# EasyEDA Pro project ProPrj_CC14_SAOs_2026-02-15.epro

# Schematic Schematic1_1
Board Name: EveLike; Create Date: 2026-01-02; Page Name: P1; Project Name: CC14_SAOs; Schematic Name: Schematic1; Update Date: 2026-01-02; Company: EasyEDA.com; Page Size: A4; Version: V1.0
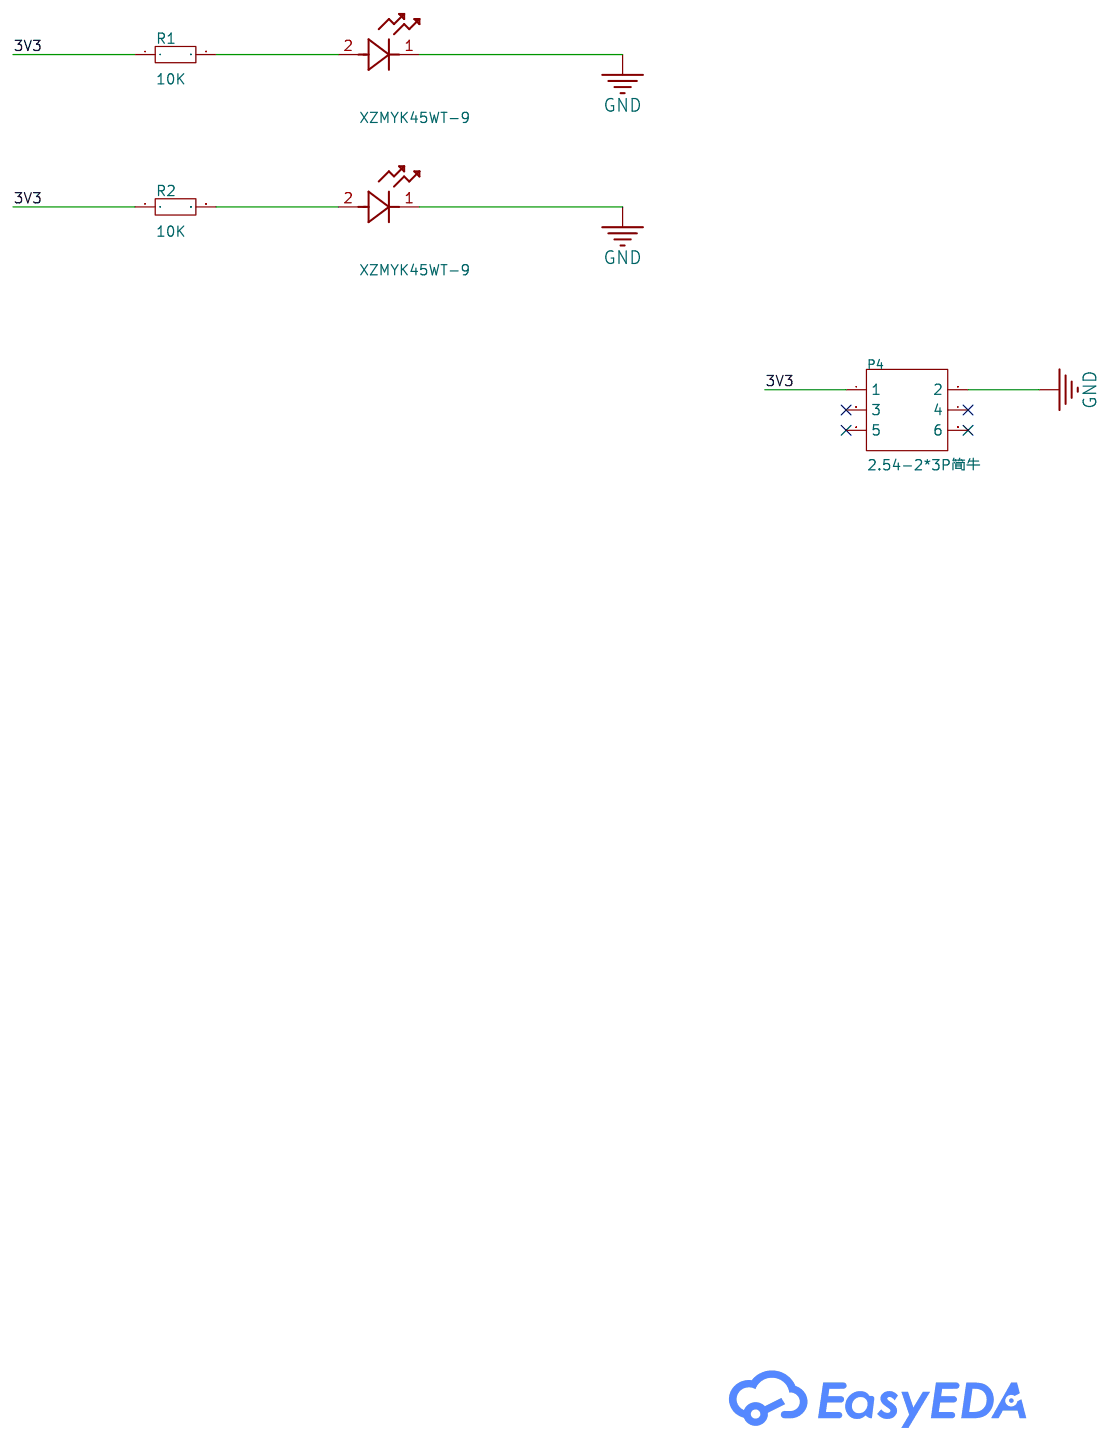
[diagram p0: schematic sheet]

## Parts
LED1  XZMYK45WT-9  [LED_SMD_PLCC2_SLD]
LED2  XZMYK45WT-9  [LED_SMD_PLCC2_SLD]
P4  2.54-2*3P简牛  [IDC-TH_6P-P2.54_C11214]  (no BOM)
R1  10K  [R1206-1]
R2  10K  [R1206-1]

## Library data of the parts
LED1 LED2 = XZMYK45WT-9
P4 = 2.54-2*3P简牛: Connector Type:IDC Header Pitch:2.54mm Holder Type:Through Hole Row Spacing:2.54mm Number of Rows:2 Contact Material:Brass Contact Plating:Gold; LCSC Part Name: 2.54mm 排数:2; Supplier Part: C11214; Manufacturer: BOOMELE(博穆精密); Supplier Footprint: 插件,P=2.54mm; JLCPCB Part Class: Extended Part; Datasheet: https://item.szlcsc.com/datasheet/2.54-2*3P%25E7%25AE%2580%25E7%2589%259B/11763.html; Supplier: LCSC; Connector Type: IDC Header; Pitch: 2.54mm; Holder Type: Through Hole; Row Spacing: 2.54mm; Number of Rows: 2; Contact Material: Brass; Contact Plating: Gold
R1 R2 = Res_0603: Supplier Footprint: 0603

## Nets
3V3: P4.1 R1.1 R2.1
GND: LED1.1 LED2.1 P4.2
$1N236: LED1.2 R1.2
$1N245: LED2.2 R2.2

Not connected (* = marked no-connect by the designer): P4 3* 4* 5* 6*

# Schematic Schematic4
Board Name: Board2; Create Date: 2026-01-09; Page Name: P1; Project Name: CC14_SAOs; Schematic Name: Schematic4; Update Date: 2026-01-09; Company: EasyEDA.com; Page Size: A4; Version: V1.0
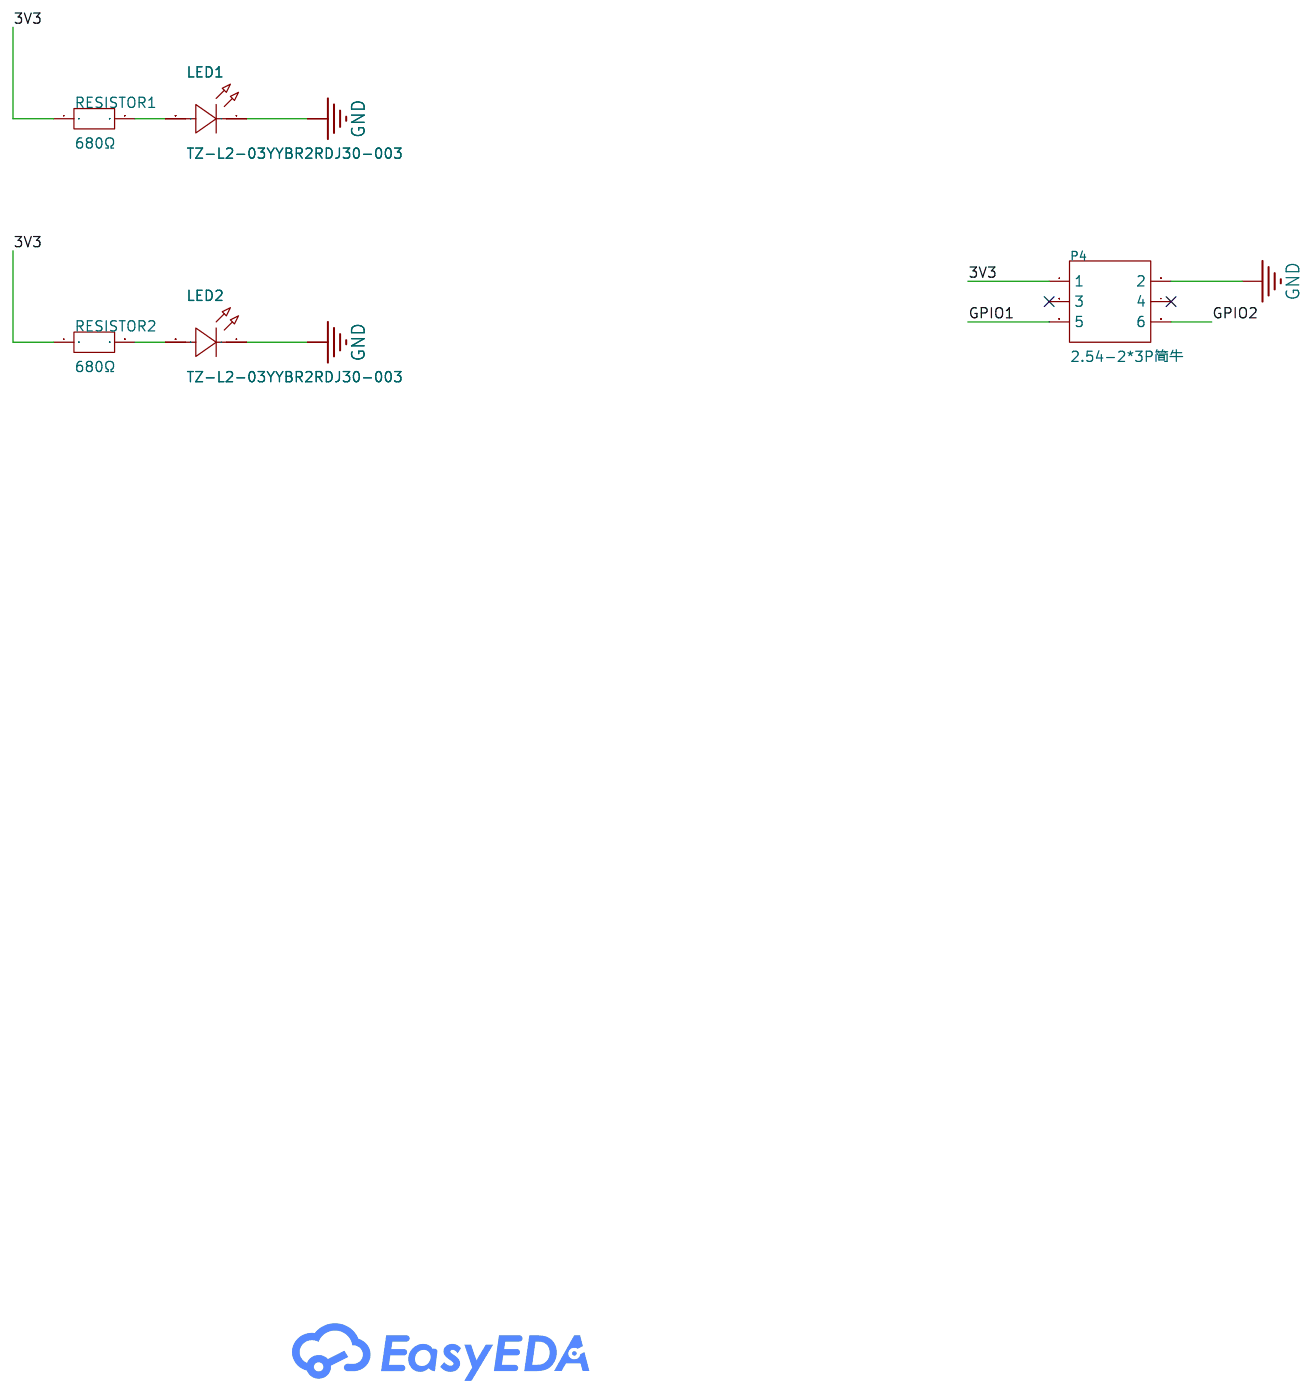
[diagram p1: schematic sheet]

## Parts
LED1  TZ-L2-03YYBR2RDJ30-003  [LED-TH_BD3.8-P2.54-RD]  (no BOM)
LED2  TZ-L2-03YYBR2RDJ30-003  [LED-TH_BD3.8-P2.54-RD]  (no BOM)
P4  2.54-2*3P简牛  [IDC-TH_6P-P2.54_C11214]  (no BOM)
RESISTOR1  680Ω  [RES-TH_BD3.4-W6.3-P7.62-SA6.8CA]
RESISTOR2  680Ω  [RES-TH_BD3.4-W6.3-P7.62-SA6.8CA]

## Library data of the parts
LED1 LED2 = TZ-L2-03YYBR2RDJ30-003: Lamp Holder Type:3mm Round Lens Illumination Color:Red Voltage - Forward(Vf):2.3V Voltage - Forward(Vf):2.3V Power(Watts):60mW Forward Current:20mA Wavelength - Dominant:620nm~625nm Wavelength - Dominant:620nm~625nm Peak Wavelength:- Diode Configuration:-; LCSC Part Name: 红灯; Supplier Part: C779429; Manufacturer: TUOZHAN(拓展光电); Supplier Footprint: 插件,D=3mm; JLCPCB Part Class: Extended Part; Datasheet: https://item.szlcsc.com/datasheet/TZ-L2-03YYBR2RDJ30-003/829090.html; Supplier: LCSC; Lamp Holder Type: 3mm Round Lens; Illumination Color: Red; Voltage - Forward(Vf): 2.3V; Power(Watts): 60mW; Forward Current: 20mA; Wavelength - Dominant: 620nm~625nm; Lens Color: Red Lens; Luminous Intensity: 600mcd; Viewing Angle: 30°; Operating Temperature: -20℃~+75℃
P4 = 2.54-2*3P简牛: Connector Type:IDC Header Pitch:2.54mm Holder Type:Through Hole Row Spacing:2.54mm Number of Rows:2 Contact Material:Brass Contact Plating:Gold; LCSC Part Name: 2.54mm 排数:2; Supplier Part: C11214; Manufacturer: BOOMELE(博穆精密); Supplier Footprint: 插件,P=2.54mm; JLCPCB Part Class: Extended Part; Datasheet: https://item.szlcsc.com/datasheet/2.54-2*3P%25E7%25AE%2580%25E7%2589%259B/11763.html; Supplier: LCSC; Connector Type: IDC Header; Pitch: 2.54mm; Holder Type: Through Hole; Row Spacing: 2.54mm; Number of Rows: 2; Contact Material: Brass; Contact Plating: Gold
RESISTOR1 RESISTOR2 = MBA02040C6800FRP00: Type:Metal Film Resistor Resistance:680Ω Tolerance:±1% Tolerance:±1% Power(Watts):400mW Temperature Coefficient:±50ppm/℃ Temperature Coefficient:±50ppm/℃ Operating Temperature:-55℃~+155℃ Operating Temperature:-55℃~+155℃; LCSC Part Name: 金属膜电阻 680Ω ±1% 400mW; Supplier Part: C1740698; Manufacturer: VISHAY(威世); Supplier Footprint: 插件; JLCPCB Part Class: Extended Part; Datasheet: https://item.szlcsc.com/datasheet/MBA02040C6800FRP00/1831479.html; Supplier: LCSC; Type: Metal Film Resistor; Tolerance: ±1%; Power(Watts): 400mW; Temperature Coefficient: ±50ppm/℃; Operating Temperature: -55℃~+155℃

## Nets
3V3: P4.1 RESISTOR1.1 RESISTOR2.1
GND: LED1.1(-) LED2.1(-) P4.2
GPIO1: P4.5
GPIO2: P4.6
Net-(LED1-2): LED1.2(+) RESISTOR1.2
Net-(LED2-2): LED2.2(+) RESISTOR2.2

Not connected (* = marked no-connect by the designer): P4 3* 4*

# Schematic Schematic2
Board Name: Bluetooth; Create Date: 2026-01-06; Page Name: P1; Project Name: CC14_SAOs; Schematic Name: Schematic2; Update Date: 2026-01-15; Company: EasyEDA.com; Page Size: A4; Version: V1.0
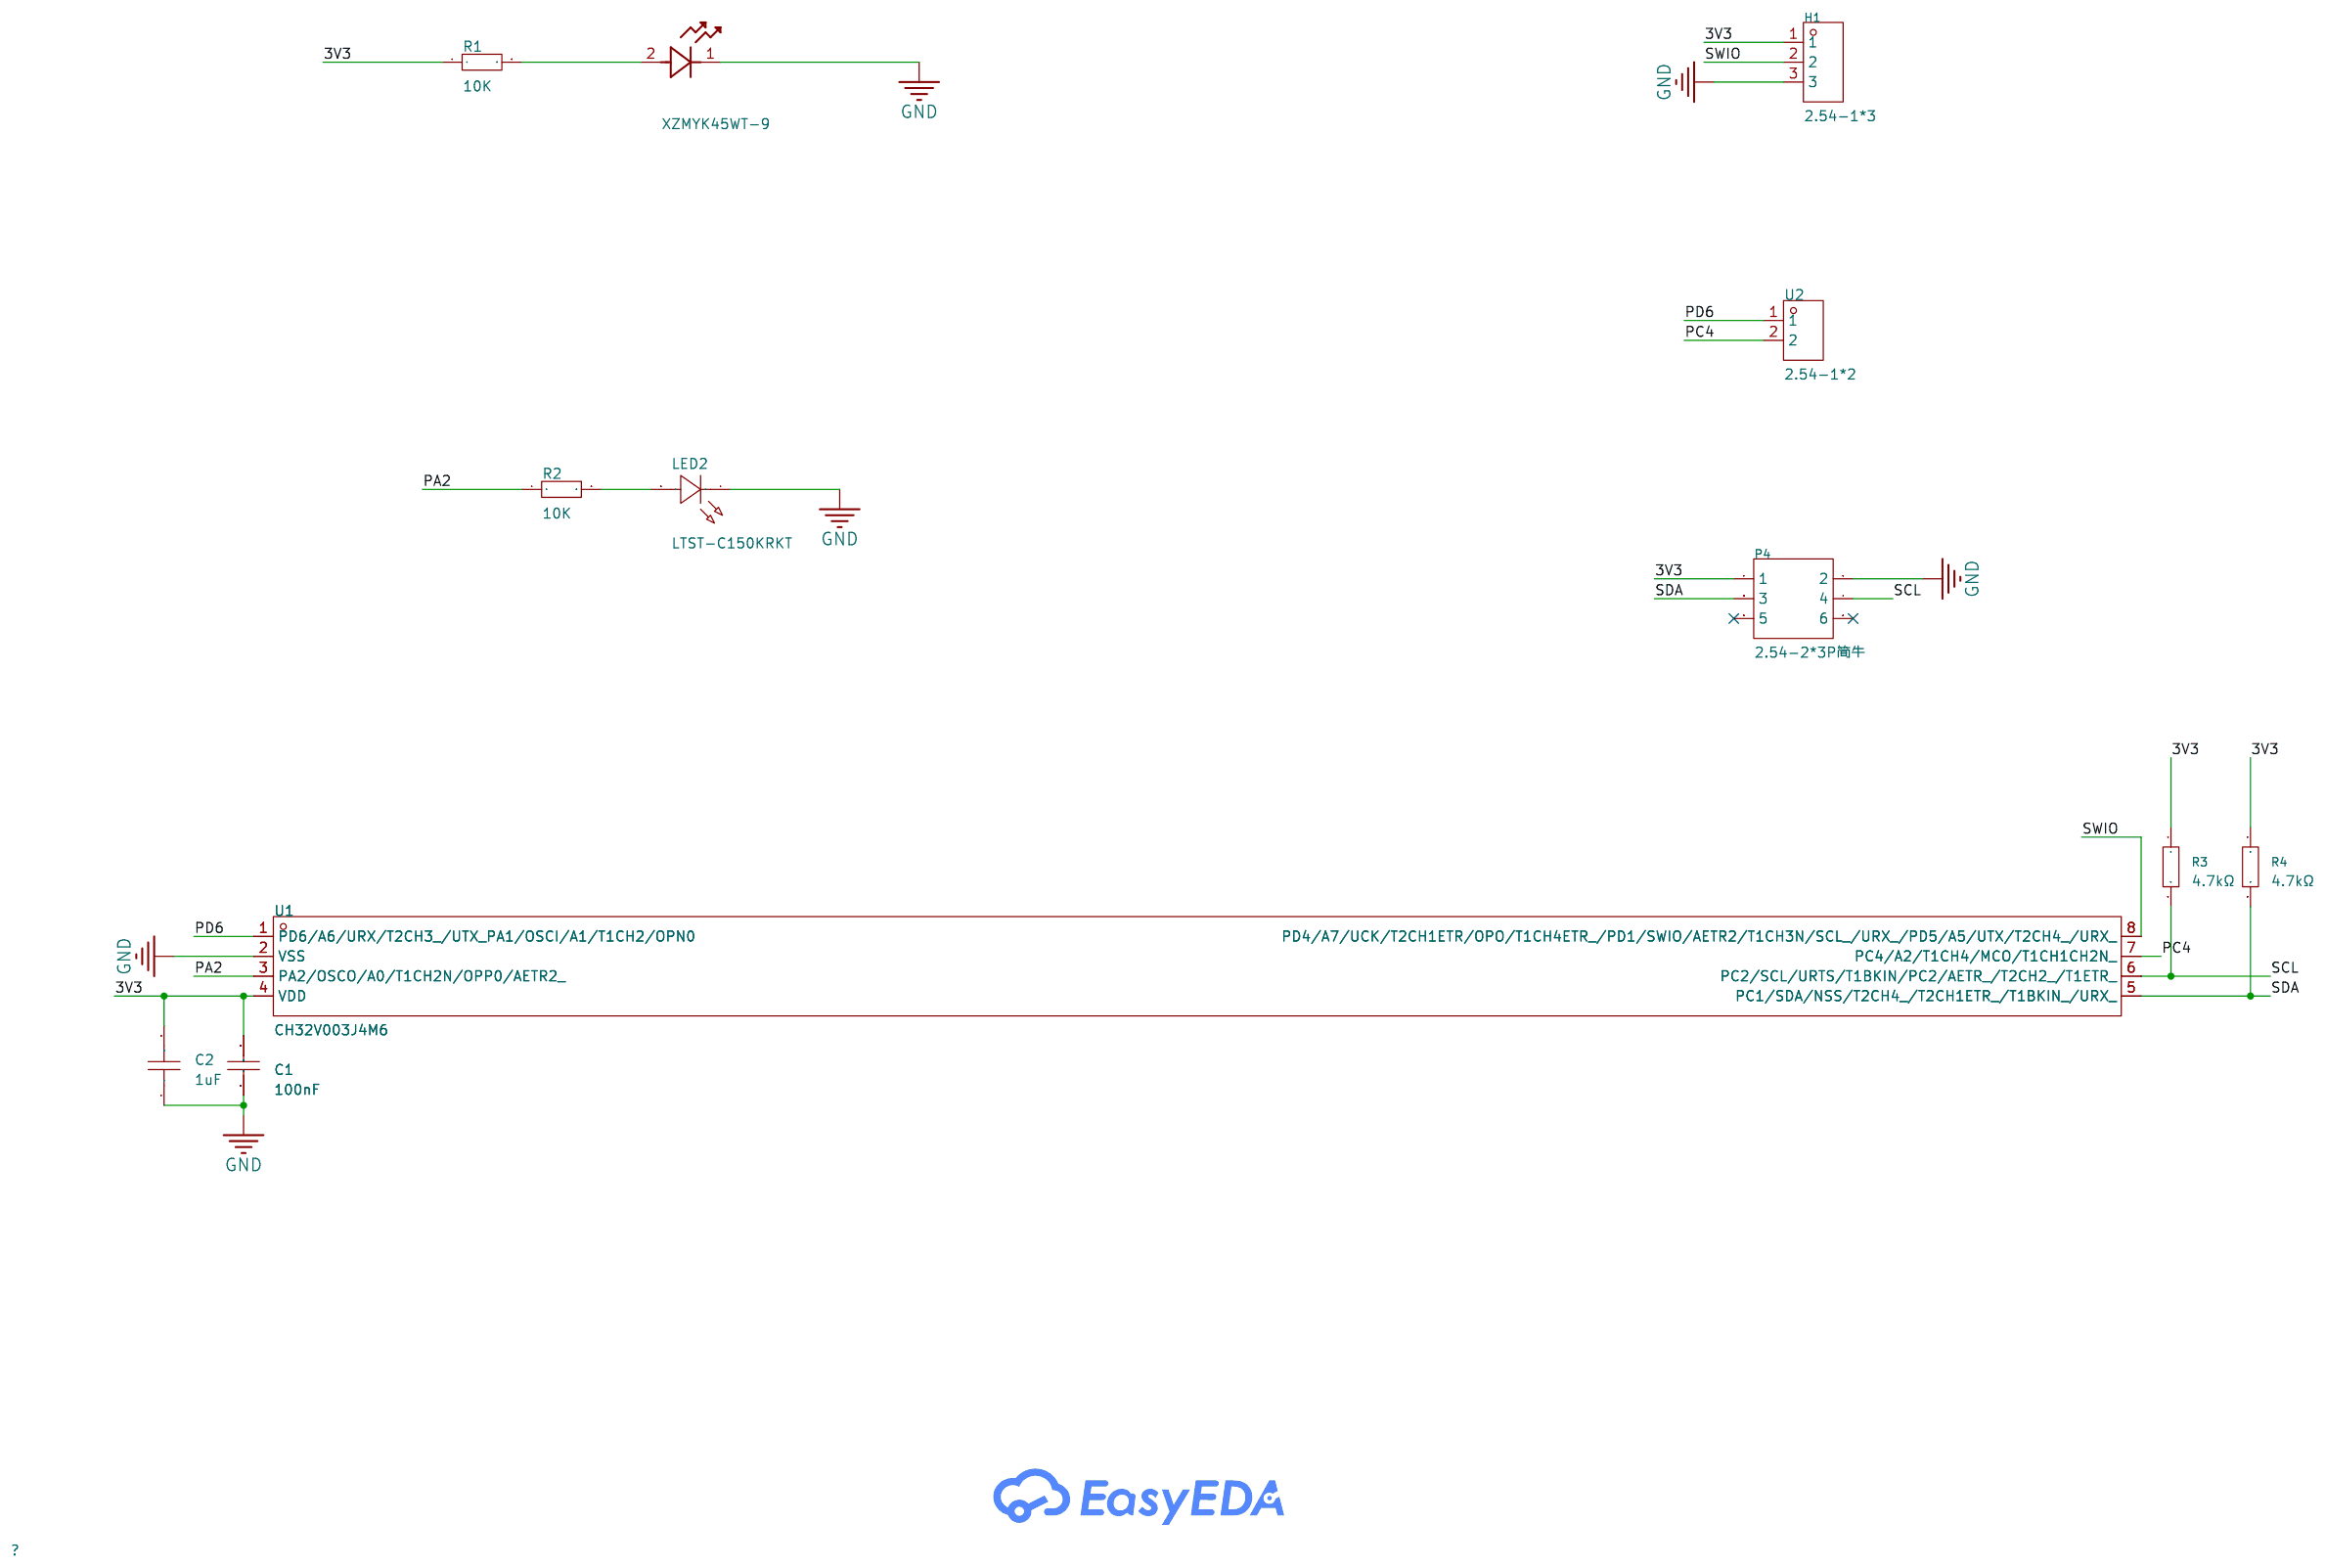
[diagram p2: schematic sheet]

## Parts
C1  100nF  [C1206]
C2  1uF  [C1206]
H1  2.54-1*3  [HDR-TH_3P-P2.54-V-M-1]
LED1  XZMYK45WT-9  [LED_SMD_PLCC2_SLD]
LED2  LTST-C150KRKT  [LED1206-RD]
P4  2.54-2*3P简牛  [IDC-TH_6P-P2.54_C11214]  (no BOM)
R1  10K  [R1206-1]
R2  10K  [R1206-1]
R3  4.7kΩ  [R1206-1]
R4  4.7kΩ  [R1206-1]
U1  CH32V003J4M6  [SOP-8_L4.9-W3.8-P1.27-LS6.0-BL]
U2  2.54-1*2  [HDR-TH_2P-P2.54-V-M]

## Library data of the parts
C1 = CL31B104KBCNNNC: Capacitance:100nF Tolerance:±10% Tolerance:±10% Voltage Rating:50V Temperature Coefficient:X7R; LCSC Part Name: 100nF ±10% 50V; Supplier Part: C24497; Manufacturer: SAMSUNG(三星); Supplier Footprint: 1206; JLCPCB Part Class: Basic Part; Datasheet: https://item.szlcsc.com/datasheet/CL31B104KBCNNNC/25237.html; Supplier: LCSC; Tolerance: ±10%; Voltage Rating: 50V; Temperature Coefficient: X7R
C2 = CL31B105KBHNNNE: Capacitance:1uF Tolerance:±10% Tolerance:±10% Voltage Rating:50V Temperature Coefficient:X7R; LCSC Part Name: 1uF ±10% 50V; Supplier Part: C1848; Manufacturer: SAMSUNG(三星); Supplier Footprint: 1206; JLCPCB Part Class: Basic Part; Datasheet: https://item.szlcsc.com/datasheet/CL31B105KBHNNNE/2200.html; Supplier: LCSC; Tolerance: ±10%; Voltage Rating: 50V; Temperature Coefficient: X7R
H1 = 2.54-1*3: Pin Structure:1x3P Pitch:2.54mm Circluar Pins/Square Pins:Pin Header Mounting Type:Through Hole Number of Rows:1 Number of Pins:3P Current Rating:2.5A Length of Mating Pin:6mm Insulation Height:2.54mm Length of End Connection Pin:3mm Contact Material:Bras; LCSC Part Name: 停产 1x3P 间距:2.54mm 方针 直插; Supplier Part: C5116482; Manufacturer: ZHOURI(洲日); Supplier Footprint: 插件,P=2.54mm; JLCPCB Part Class: Extended Part; Datasheet: https://item.szlcsc.com/datasheet/2.54-1*3/5692725.html; Supplier: LCSC; Pin Structure: 1x3P; Pitch: 2.54mm; Circluar Pins/Square Pins: Pin Header; Mounting Type: Through Hole; Number of Rows: 1; Number of Pins: 3P; Current Rating: 2.5A; Length of Mating Pin: 6mm; Insulation Height: 2.54mm; Length of End Connection Pin: 3mm; Contact Material: Brass; Contact Plating: Gold; Operating Temperature: -40℃~+105℃
LED1 = XZMYK45WT-9
LED2 = LTST-C150KRKT: Emitted Color:Red Forward Voltage (VF):2V Forward Voltage (VF):2V Power Dissipation:62.5mW Forward Current:20mA Dominant Wavelength:624nm Dominant Wavelength:624nm Peak Wavelength:639nm Diode Configuration:- Lens Color:无色透明透镜 Color Temperature:- Color Tem; LCSC Part Name: 红灯; Supplier Part: C125086; Manufacturer: LITEON(光宝); Supplier Footprint: 1206; JLCPCB Part Class: Extended Part; Datasheet: https://atta.szlcsc.com/upload/public/pdf/source/20180129/C125086_15171893705641316613.pdf; Supplier: LCSC; Emitted Color: Red; Forward Voltage (VF): 2V; Power Dissipation: 62.5mW; Forward Current: 20mA; Dominant Wavelength: 624nm; Peak Wavelength: 639nm; Lens Color: 无色透明透镜; Luminous Intensity: 54mcd; Viewing Angle: 130°; Operating Temperature: -30℃~+85℃
P4 = 2.54-2*3P简牛: Connector Type:IDC Header Pitch:2.54mm Holder Type:Through Hole Row Spacing:2.54mm Number of Rows:2 Contact Material:Brass Contact Plating:Gold; LCSC Part Name: 2.54mm 排数:2; Supplier Part: C11214; Manufacturer: BOOMELE(博穆精密); Supplier Footprint: 插件,P=2.54mm; JLCPCB Part Class: Extended Part; Datasheet: https://item.szlcsc.com/datasheet/2.54-2*3P%25E7%25AE%2580%25E7%2589%259B/11763.html; Supplier: LCSC; Connector Type: IDC Header; Pitch: 2.54mm; Holder Type: Through Hole; Row Spacing: 2.54mm; Number of Rows: 2; Contact Material: Brass; Contact Plating: Gold
R1 R2 = Res_0603: Supplier Footprint: 0603
R3 R4 = 1206W4F4701T5E: Type:Thick Film Resistor Resistance:4.7kΩ Tolerance:±1% Tolerance:±1% Power(Watts):250mW Voltage-Supply(Max):200V Temperature Coefficient:±100ppm/℃ Temperature Coefficient:±100ppm/℃ Operating Temperature:-55℃~+155℃ Operating Temperature:-55℃~+155℃; LCSC Part Name: 4.7kΩ ±1% 250mW 厚膜电阻; Supplier Part: C17936; Manufacturer: UNI-ROYAL(厚声); Supplier Footprint: 1206; JLCPCB Part Class: Basic Part; Datasheet: https://item.szlcsc.com/datasheet/1206W4F4701T5E/18624.html; Supplier: LCSC; Type: Thick Film Resistor; Tolerance: ±1%; Power(Watts): 250mW; Voltage-Supply(Max): 200V; Temperature Coefficient: ±100ppm/℃; Operating Temperature: -55℃~+155℃
U1 = CH32V003J4M6_C5346354: LCSC Part Name: QingKe V2微处理器; Supplier Part: C5346354; Manufacturer: WCH(南京沁恒); Supplier Footprint: SOP-8; JLCPCB Part Class: Extended Part; Datasheet: https://item.szlcsc.com/datasheet/CH32V003J4M6/6127776.html; Supplier: LCSC
U2 = 2.54-1*2: Pin Structure:1x2P Pitch:2.54mm Circluar Pins/Square Pins:Pin Header Mounting Type:Through Hole Number of Rows:1 Number of Pins:2P Current Rating:2.5A Length of Mating Pin:6mm Insulation Height:2.54mm Length of End Connection Pin:3mm Contact Material:Bras; LCSC Part Name: 停产 1x2P 间距:2.54mm 方针 直插; Supplier Part: C5116481; Manufacturer: ZHOURI(洲日); Supplier Footprint: 插件,P=2.54mm; JLCPCB Part Class: Extended Part; Datasheet: https://item.szlcsc.com/datasheet/2.54-1*2/5692724.html; Supplier: LCSC; Pin Structure: 1x2P; Pitch: 2.54mm; Circluar Pins/Square Pins: Pin Header; Mounting Type: Through Hole; Number of Rows: 1; Number of Pins: 2P; Current Rating: 2.5A; Length of Mating Pin: 6mm; Insulation Height: 2.54mm; Length of End Connection Pin: 3mm; Contact Material: Brass; Contact Plating: Gold; Operating Temperature: -40℃~+105℃

## Nets
3V3: C1.1 C2.2 H1.1 P4.1 R1.1 R3.1 R4.1 U1.4(VDD)
GND: C1.2 C2.1 H1.3 LED1.1 LED2.1(K) P4.2 U1.2(VSS)
PA2: R2.1 U1.3(PA2/OSCO/A0/T1CH2N/OPP0/AETR2_)
PC4: U1.7(PC4/A2/T1CH4/MCO/T1CH1CH2N_) U2.2
PD6: U1.1(PD6/A6/URX/T2CH3_/UTX_PA1/OSCI/A1/T1CH2/OPN0) U2.1
SCL: P4.4 R3.2 U1.6(PC2/SCL/URTS/T1BKIN/PC2/AETR_/T2CH2_/T1ETR_)
SDA: P4.3 R4.2 U1.5(PC1/SDA/NSS/T2CH4_/T2CH1ETR_/T1BKIN_/URX_)
SWIO: H1.2 U1.8(PD4/A7/UCK/T2CH1ETR/OPO/T1CH4ETR_/PD1/SWIO/AETR2/T1CH3N/SCL_/URX_/PD5/A5/UTX/T2CH4_/URX_)
Net-(LED1-2): LED1.2 R1.2
Net-(LED2-2): LED2.2(A) R2.2

Not connected (* = marked no-connect by the designer): P4 5* 6*

# Board Hackichu
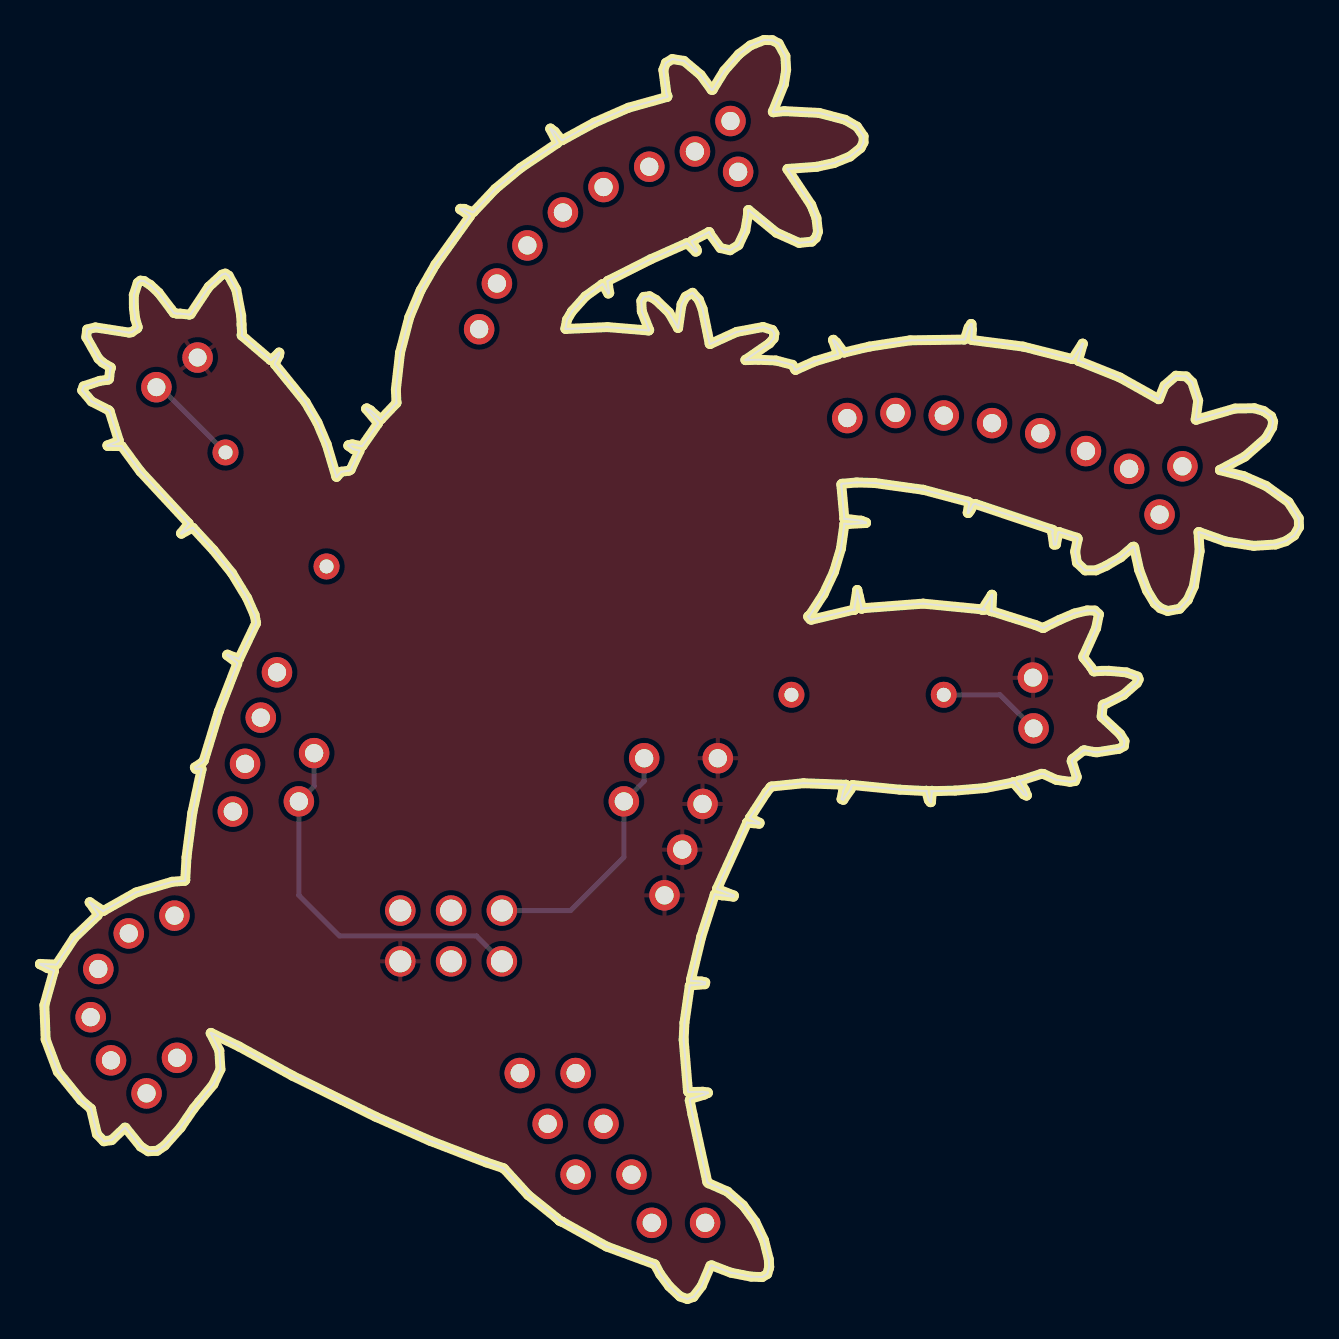
[diagram p3: board, top side]
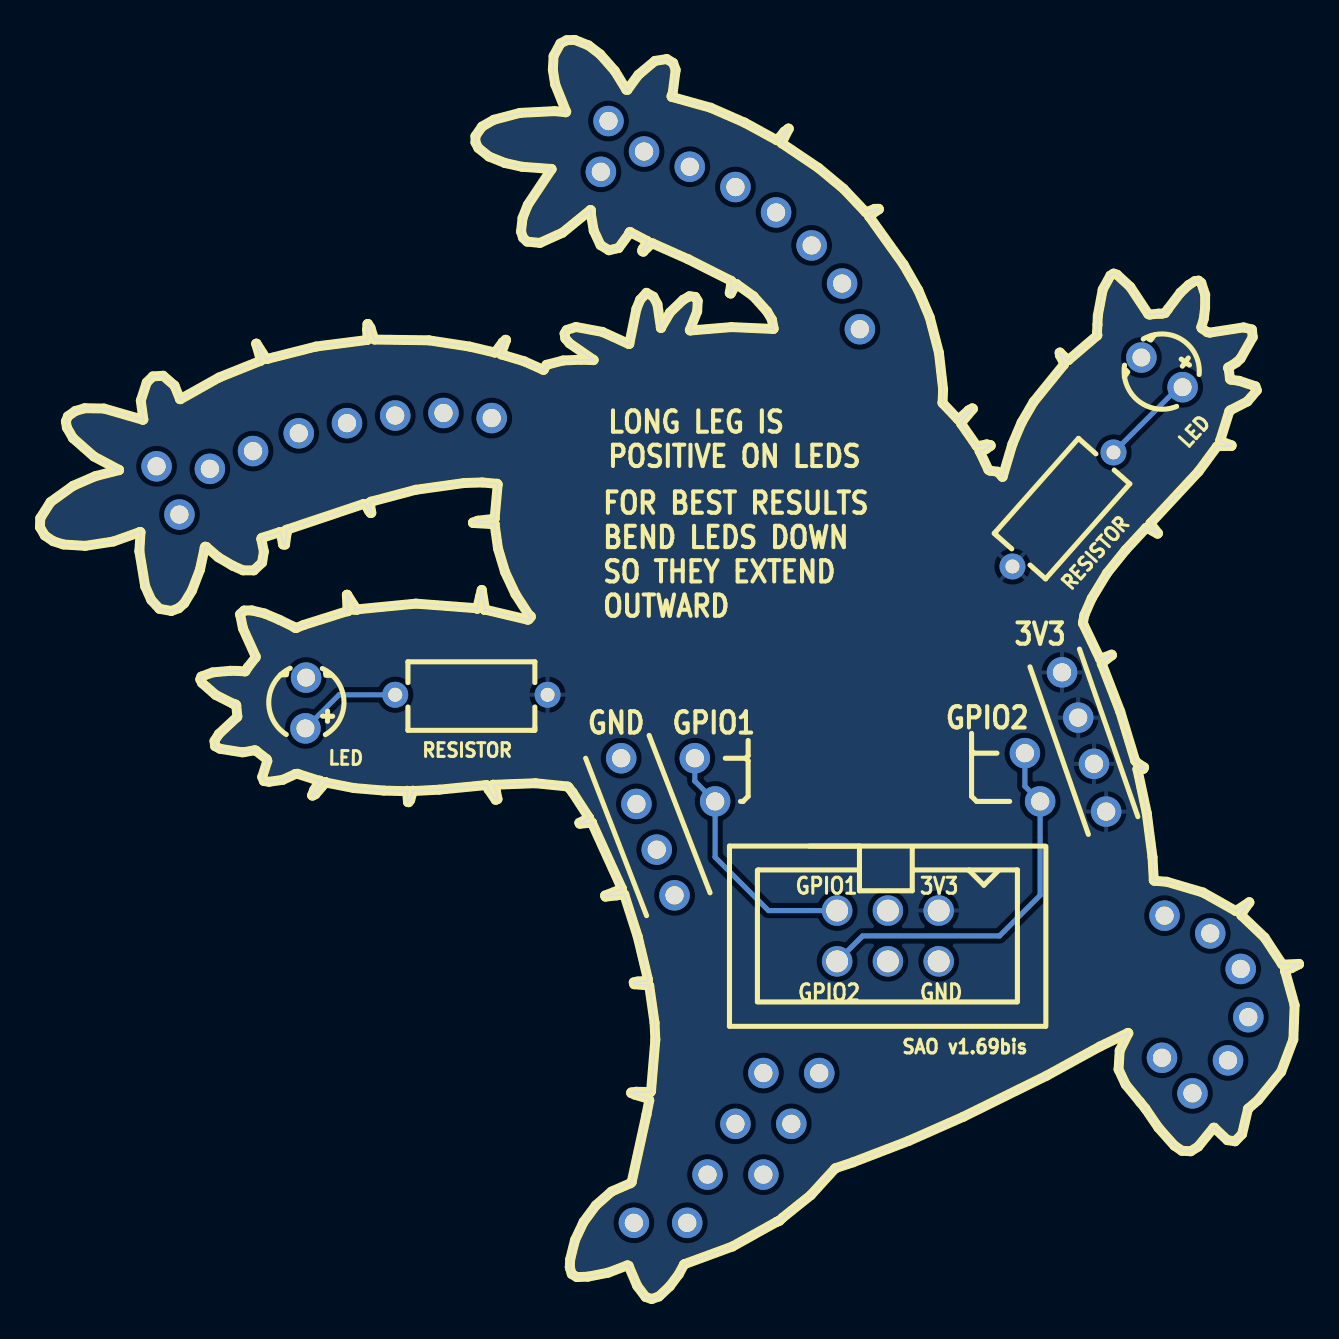
[diagram p4: board, bottom side, seen from below]

Outline 62.98 x 62.98 mm; copper layers: Top Layer, Bottom Layer. Coordinates in mm from the lower left corner of the outline.
Stack: Top Layer 0.035mm / Dielectric1 1.51mm FR4 er 4.5 / Bottom Layer 0.035mm

## Design rules (mm)
template: JLCPCB Capability(Two Layers Board)
spacing copperThickness1oz (default): track to track 0.102, other pairs 0.152 to 0.3
spacing copperThickness2oz: track to track 0.203, other pairs 0.152 to 0.3
track width copperThickness1oz (default): min 0.127, default 0.254, max 2.54
track width copperThickness2oz: min 0.203, default 0.254, max 2.54
differential pair differentialPair (default): width min 0.127, default 0.254, max 2.54; gap min 0.152, default 0.152
via viaSize (default): diameter min 0.5, default 0.61, max 10; hole min 0.3, default 0.305, max 6.3

## Placement (name value [footprint] x y rotation side)
LED  -  [LED-TH_BD3.8-P2.54-RD]  49.68 29.82 270.7 bottom
LED#2  -  [LED-TH_BD3.8-P2.54-RD]  6.85 46.36 215.8 bottom
NOREF  -  [Pad_e2568]  26.79 11.3 0 top
NOREF#2  -  [Pad_e2357]  6.85 12.07 0 top
NOREF#3  -  [Pad_e2186]  56 39.24 0 top
NOREF#4  -  [Pad_e1327]  11.05 29.08 0 top
NOREF#5  -  [Pad_e2185]  57.15 41.66 0 top
NOREF#6  -  [Pad_e2391]  6.73 19.18 0 top
NOREF#7  -  [Pad_e1329]  9.65 24.39 0 top
NOREF#8  -  [Pad_e2564]  26.79 6.22 0 top
NOREF#9  -  [Pad_e1334]  31.24 20.19 0 top
NOREF#10  -  [Pad_e1555]  30.48 56.64 0 top
NOREF#11  -  [Pad_e2098]  52.32 42.42 0 top
NOREF#12  -  [Pad_e1326]  11.85 31.35 0 top
NOREF#13  -  [Pad_e1513]  30.22 27.05 0 top
NOREF#14  -  [Pad_e2563]  29.59 6.22 0 top
NOREF#15  -  [Pad_e1557]  34.92 56.39 0 top
NOREF#16  -  [Pad_e2097]  50.03 43.31 0 top
NOREF#17  -  [Pad_e1896]  40.38 44.07 0 top
NOREF#18  -  [Pad_e1897]  42.8 44.32 0 top
NOREF#19  -  [Pad_e1395]  13.71 27.31 0 top
NOREF#20  -  [Pad_e2099]  54.48 41.53 0 top
NOREF#21  -  [Pad_e2387]  3.55 11.94 0 top
NOREF#22  -  [Pad_e2566]  25.4 8.76 0 top
NOREF#23  -  [Pad_e1396]  12.95 24.89 0 top
NOREF#24  -  [Pad_e2569]  24 11.3 0 top
NOREF#25  -  [Pad_e1553]  26.16 54.36 0 top
NOREF#26  -  [Pad_e1552]  24.38 52.71 0 top
NOREF#27  -  [Pad_e1899]  47.62 43.82 0 top
NOREF#28  -  [Pad_e1550]  21.97 48.52 0 top
NOREF#29  -  [Pad_e1332]  33.14 24.77 0 top
NOREF#30  -  [Pad_e2388]  2.54 14.1 0 top
NOREF#31  -  [Pad_e1330]  33.91 27.05 0 top
NOREF#32  -  [Pad_e1333]  32.13 22.48 0 top
NOREF#33  -  [Pad_e2565]  28.19 8.76 0 top
NOREF#34  -  [Pad_e2389]  2.92 16.51 0 top
NOREF#35  -  [Pad_e1783]  32.76 57.41 0 top
NOREF#36  -  [Pad_e2562]  30.6 3.81 0 top
NOREF#37  -  [Pad_e1514]  29.21 24.89 0 top
NOREF#38  -  [Pad_e1556]  34.54 58.93 0 top
NOREF#39  -  [Pad_e2561]  33.27 3.81 0 top
NOREF#40  -  [Pad_e1898]  45.21 44.2 0 top
NOREF#41  -  [Pad_e1328]  10.26 26.77 0 top
NOREF#42  -  [Pad_e2390]  4.44 18.29 0 top
NOREF#43  -  [Pad_e1554]  28.19 55.63 0 top
NOREF#44  -  [Pad_e1551]  22.86 50.8 0 top
NOREF#45  -  [Pad_e2356]  5.33 10.29 0 top
RESISTOR  -  [RES-TH_BD3.4-W6.3-P7.62-SA6.8CA]  11.81 39.5 131.5 bottom
RESISTOR#2  -  [RES-TH_BD3.4-W6.3-P7.62-SA6.8CA]  41.4 30.23 0 bottom
SAO v1.69bis  -  [IDC-TH_6P-P2.54_C11214]  20.56 18.16 0 bottom

## Footprints (pads in the part's own frame, mm; a bottom-side part is the same pattern mirrored in y, then rotated)
IDC-TH_6P-P2.54_C11214
  round 1.524 hole 1.1: 1(-2.54,-1.27) 2(-2.54,1.27) 3(0,-1.27) 4(0,1.27) 5(2.54,-1.27) 6(2.54,1.27)
LED-TH_BD3.8-P2.54-RD
  round 1.524 hole 0.9: 1(-1.27,0) 2(1.27,0)
Pad_e1326
  round 1.524 hole 0.914: 1(0,0)
Pad_e1327
  round 1.524 hole 0.914: 2(0,0)
Pad_e1328
  round 1.524 hole 0.914: 3(0,0)
Pad_e1329
  round 1.524 hole 0.914: 4(0,0)
Pad_e1330
  round 1.524 hole 0.914: 5(0,0)
Pad_e1332
  round 1.524 hole 0.914: 1(0,0)
Pad_e1333
  round 1.524 hole 0.914: 2(0,0)
Pad_e1334
  round 1.524 hole 0.914: 3(0,0)
Pad_e1395
  round 1.524 hole 0.914: 1(0,0)
Pad_e1396
  round 1.524 hole 0.914: 2(0,0)
Pad_e1513
  round 1.524 hole 0.914: 1(0,0)
Pad_e1514
  round 1.524 hole 0.914: 2(0,0)
Pad_e1550
  round 1.524 hole 0.914: 1(0,0)
Pad_e1551
  round 1.524 hole 0.914: 2(0,0)
Pad_e1552
  round 1.524 hole 0.914: 3(0,0)
Pad_e1553
  round 1.524 hole 0.914: 4(0,0)
Pad_e1554
  round 1.524 hole 0.914: 5(0,0)
Pad_e1555
  round 1.524 hole 0.914: 6(0,0)
Pad_e1556
  round 1.524 hole 0.914: 7(0,0)
Pad_e1557
  round 1.524 hole 0.914: 8(0,0)
Pad_e1783
  round 1.524 hole 0.914: 6(0,0)
Pad_e1896
  round 1.524 hole 0.914: 1(0,0)
Pad_e1897
  round 1.524 hole 0.914: 2(0,0)
Pad_e1898
  round 1.524 hole 0.914: 3(0,0)
Pad_e1899
  round 1.524 hole 0.914: 4(0,0)
Pad_e2097
  round 1.524 hole 0.914: 1(0,0)
Pad_e2098
  round 1.524 hole 0.914: 2(0,0)
Pad_e2099
  round 1.524 hole 0.914: 3(0,0)
Pad_e2185
  round 1.524 hole 0.914: 1(0,0)
Pad_e2186
  round 1.524 hole 0.914: 2(0,0)
Pad_e2356
  round 1.524 hole 0.914: 1(0,0)
Pad_e2357
  round 1.524 hole 0.914: 2(0,0)
Pad_e2387
  round 1.524 hole 0.914: 1(0,0)
Pad_e2388
  round 1.524 hole 0.914: 2(0,0)
Pad_e2389
  round 1.524 hole 0.914: 3(0,0)
Pad_e2390
  round 1.524 hole 0.914: 4(0,0)
Pad_e2391
  round 1.524 hole 0.914: 5(0,0)
Pad_e2561
  round 1.524 hole 0.914: 1(0,0)
Pad_e2562
  round 1.524 hole 0.914: 2(0,0)
Pad_e2563
  round 1.524 hole 0.914: 3(0,0)
Pad_e2564
  round 1.524 hole 0.914: 4(0,0)
Pad_e2565
  round 1.524 hole 0.914: 5(0,0)
Pad_e2566
  round 1.524 hole 0.914: 6(0,0)
Pad_e2568
  round 1.524 hole 0.914: 1(0,0)
Pad_e2569
  round 1.524 hole 0.914: 2(0,0)
RES-TH_BD3.4-W6.3-P7.62-SA6.8CA
  round 1.3 hole 0.7: 1(-3.81,0) 2(3.81,0)

## Nets
3V3: NOREF#4.2 NOREF#7.4 NOREF#12.1 NOREF#41.3 RESISTOR.1 RESISTOR#2.1 SAO v1.69bis.1
GND: LED.1 LED#2.1 NOREF#9.3 NOREF#29.1 NOREF#31.5 NOREF#32.2 SAO v1.69bis.2
GPIO1: NOREF#13.1 NOREF#37.2 SAO v1.69bis.5
GPIO2: NOREF#19.1 NOREF#23.2 SAO v1.69bis.6
$1N308: LED#2.2 RESISTOR.2
$1N312: LED.2 RESISTOR#2.2

Pads without a net: NOREF 1; NOREF#2 2; NOREF#3 2; NOREF#5 1; NOREF#6 5; NOREF#8 4; NOREF#10 6; NOREF#11 2; NOREF#14 3; NOREF#15 8; NOREF#16 1; NOREF#17 1; NOREF#18 2; NOREF#20 3; NOREF#21 1; NOREF#22 6; NOREF#24 2; NOREF#25 4; NOREF#26 3; NOREF#27 4; NOREF#28 1; NOREF#30 2; NOREF#33 5; NOREF#34 3; NOREF#35 6; NOREF#36 2; NOREF#38 7; NOREF#39 1; NOREF#40 3; NOREF#42 4; NOREF#43 5; NOREF#44 2; NOREF#45 1; SAO v1.69bis 3 4

## Routing (per net, layer and track width the routed paths; a pad name or vN(x,y) marks a point on that pad's centre or on a via; arc(x,y) is an arc through that point)
GPIO1: length 12.6
  Bottom Layer w0.254: NOREF#13.1 30.22,25.91 NOREF#37.2 29.21,22.1 26.54,19.43 SAO v1.69bis.5
GPIO2: length 18.9
  Bottom Layer w0.254: SAO v1.69bis.6 21.83,18.16 14.98,18.16 12.95,20.19 NOREF#23.2 13.71,25.66 NOREF#19.1
$1N308: length 4.7
  Bottom Layer w0.254: 5.96,45.56 6.07,45.56 RESISTOR.2
$1N312: length 5.2
  Bottom Layer w0.254: RESISTOR#2.2 48.02,30.23 LED.2

## Copper pours and planes (outline as drawn; the poured copper is in the pictures)
3V3 on Bottom Layer: -2.29,65.66 66.93,65.66 66.93,-3.68 -2.29,-3.68
GND on Top Layer: -0.51,65.41 65.15,65.41 65.15,-2.41 -0.51,-2.41

## Text on the board
Bottom Silkscreen Layer: 3V3 | GND | GPIO2 | GPIO1 | LONG LEG IS / POSITIVE ON LEDS | FOR BEST RESULTS / BEND LEDS DOWN / SO THEY EXTEND / OUTWARD

# Board Enigmox
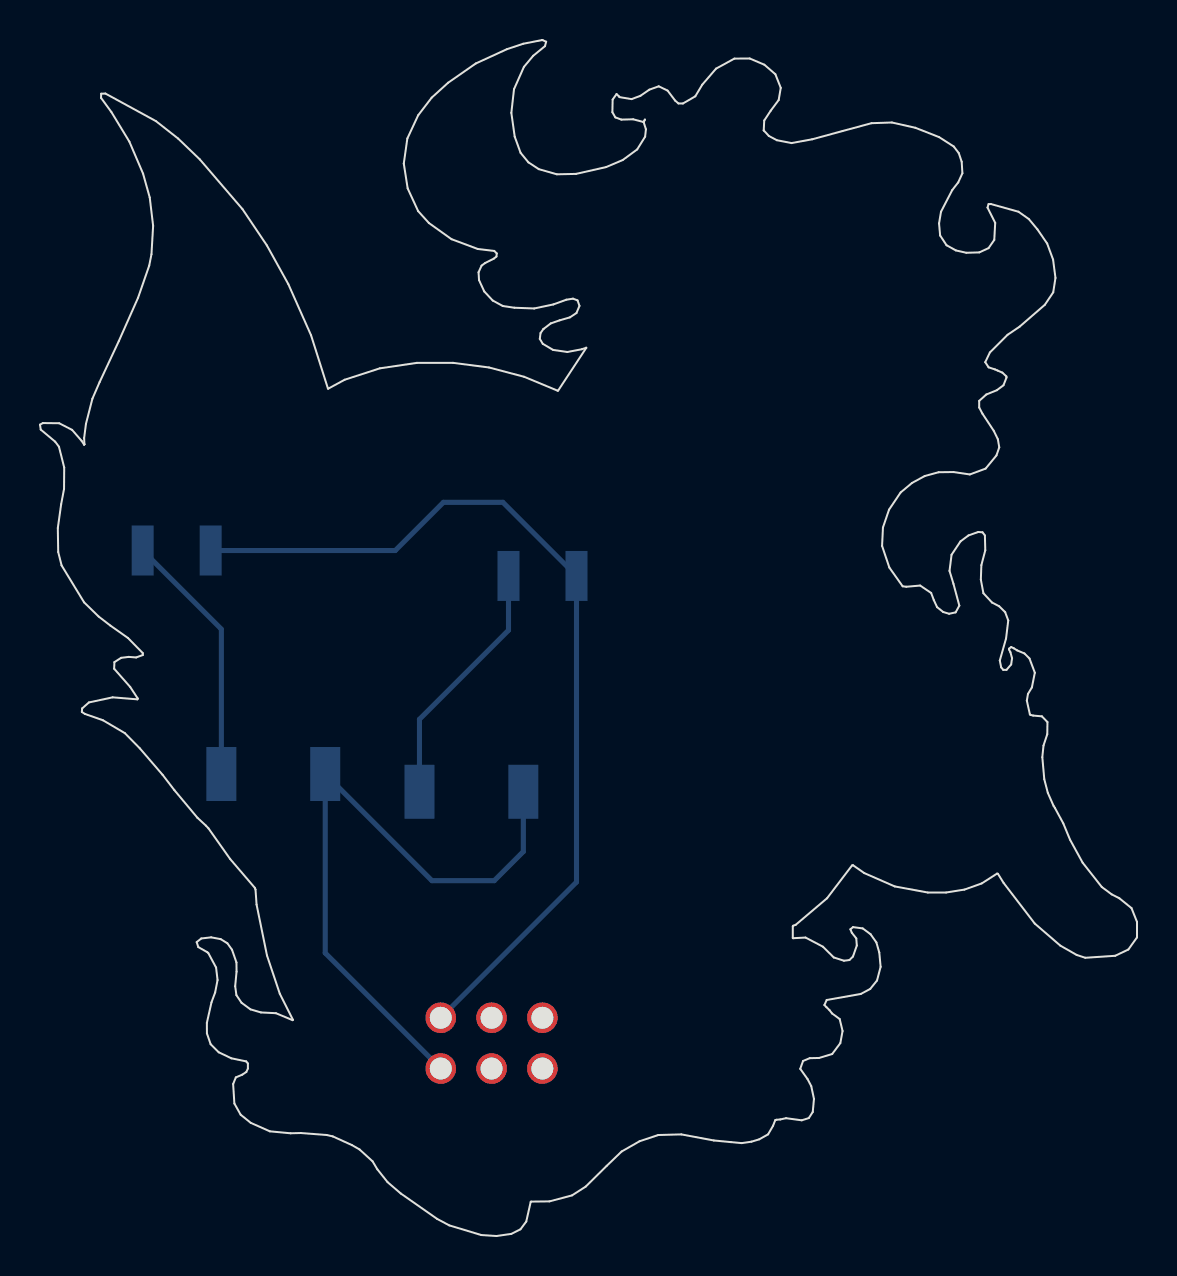
[diagram p5: board, top side]
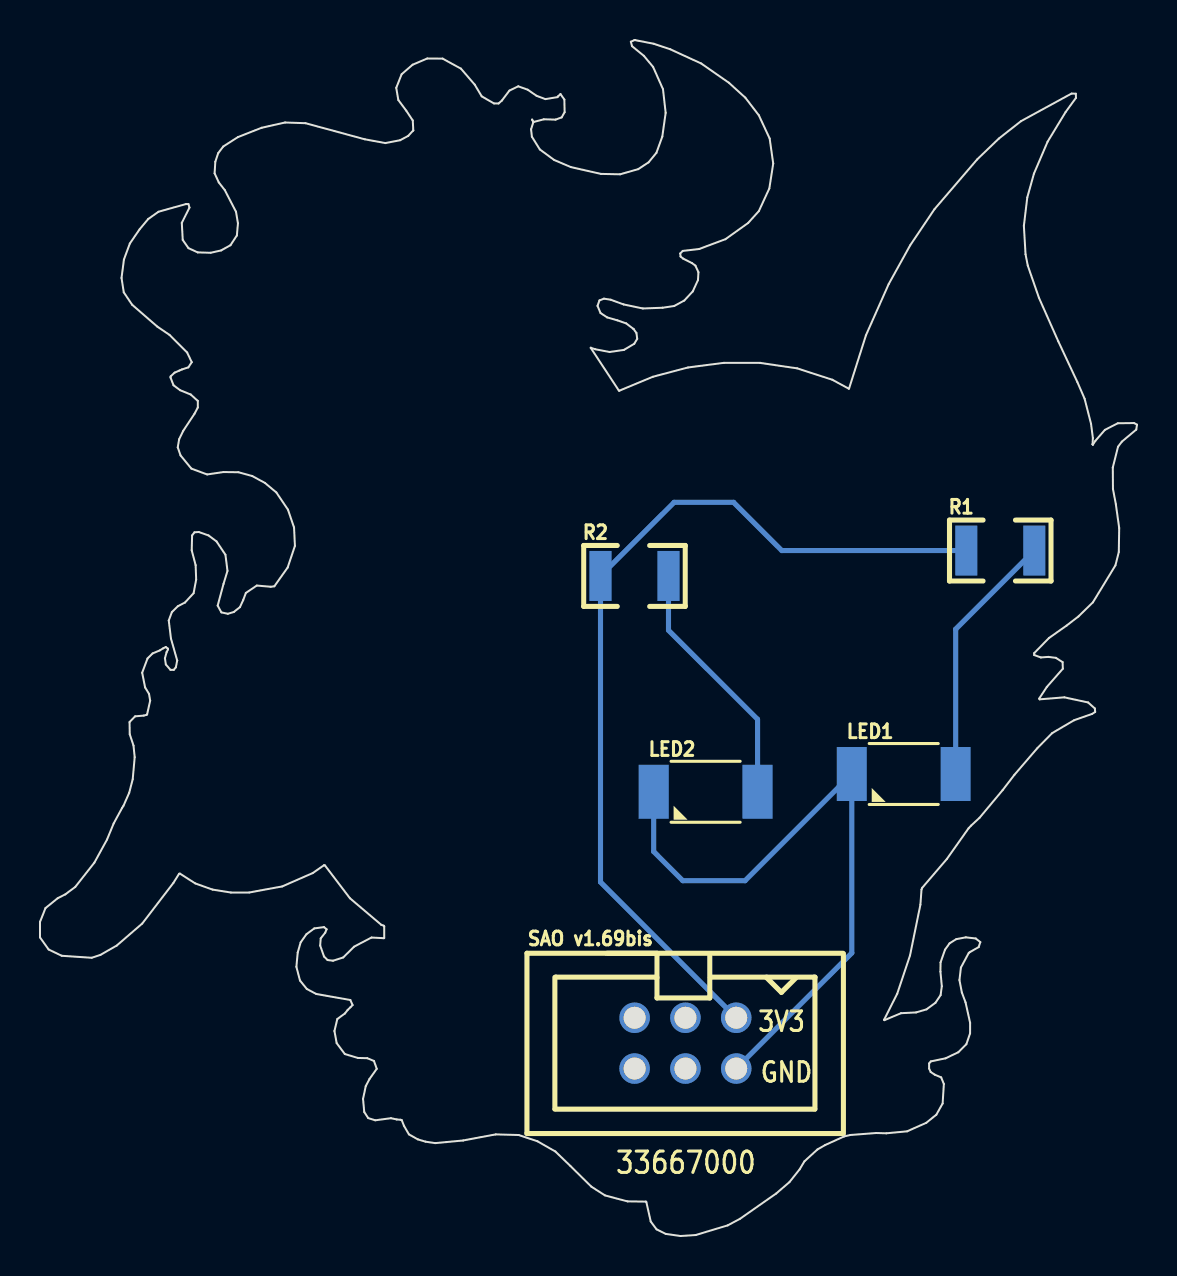
[diagram p6: board, bottom side, seen from below]

Outline 54.86 x 59.82 mm; copper layers: Top Layer, Bottom Layer. Coordinates in mm from the lower left corner of the outline.
Stack: Top Layer 0.035mm / Dielectric1 1.51mm FR4 er 4.5 / Bottom Layer 0.035mm

## Design rules (mm)
template: JLCPCB Capability(Two Layers Board)
spacing copperThickness1oz (default): track to track 0.102, other pairs 0.152 to 0.3
spacing copperThickness2oz: track to track 0.203, other pairs 0.152 to 0.3
track width copperThickness1oz (default): min 0.127, default 0.254, max 2.54
track width copperThickness2oz: min 0.203, default 0.254, max 2.54
differential pair differentialPair (default): width min 0.127, default 0.254, max 2.54; gap min 0.152, default 0.152
via viaSize (default): diameter min 0.5, default 0.61, max 10; hole min 0.3, default 0.305, max 6.3

## Placement (name value [footprint] x y rotation side)
LED1  XZMYK45WT-9  [LED_SMD_PLCC2_SLD]  11.67 23.11 180 bottom
LED2  XZMYK45WT-9  [LED_SMD_PLCC2_SLD]  21.57 22.22 180 bottom
R1  10K  [R1206-1]  6.84 34.28 180 bottom
R2  10K  [R1206-1]  25.13 33.01 180 bottom
SAO v1.69bis  -  [IDC-TH_6P-P2.54_C11214]  22.58 9.65 0 bottom

## Footprints (pads in the part's own frame, mm; a bottom-side part is the same pattern mirrored in y, then rotated)
IDC-TH_6P-P2.54_C11214
  round 1.524 hole 1.1: 1(-2.54,-1.27) 2(-2.54,1.27) 3(0,-1.27) 4(0,1.27) 5(2.54,-1.27) 6(2.54,1.27)
LED_SMD_PLCC2_SLD
  rect 1.5x2.7 smd: 1(-2.597,0) 2(2.597,0)
R1206-1
  rect 1.1x2.5 smd: 1(-1.7,0) 2(1.7,0)

## Nets
3V3: R1.1 R2.1 SAO v1.69bis.1
GND: LED1.1 LED2.1 SAO v1.69bis.2
$1N236: LED1.2 R1.2
$1N245: LED2.2 R2.2

Pads without a net: SAO v1.69bis 3 4 5 6

## Routing (per net, layer and track width the routed paths; a pad name or vN(x,y) marks a point on that pad's centre or on a via; arc(x,y) is an arc through that point)
3V3: length 45.7
  Bottom Layer w0.254: SAO v1.69bis.1 26.83,17.7 R2.1 23.14,36.7 20.17,36.7 17.76,34.28 R1.1
GND: length 32.8
  Bottom Layer w0.254: SAO v1.69bis.2 14.26,14.15 LED1.1 19.6,17.77 22.72,17.77 24.17,19.23 LED2.1
$1N236: length 12.8
  Bottom Layer w0.254: LED1.2 9.07,30.35 R1.2
$1N245: length 12.6
  Bottom Layer w0.254: LED2.2 18.98,25.84 23.43,30.3 R2.2

## Text on the board
Bottom Silkscreen Layer: GND | 3V3 | 33667000

# Board Glyphbat
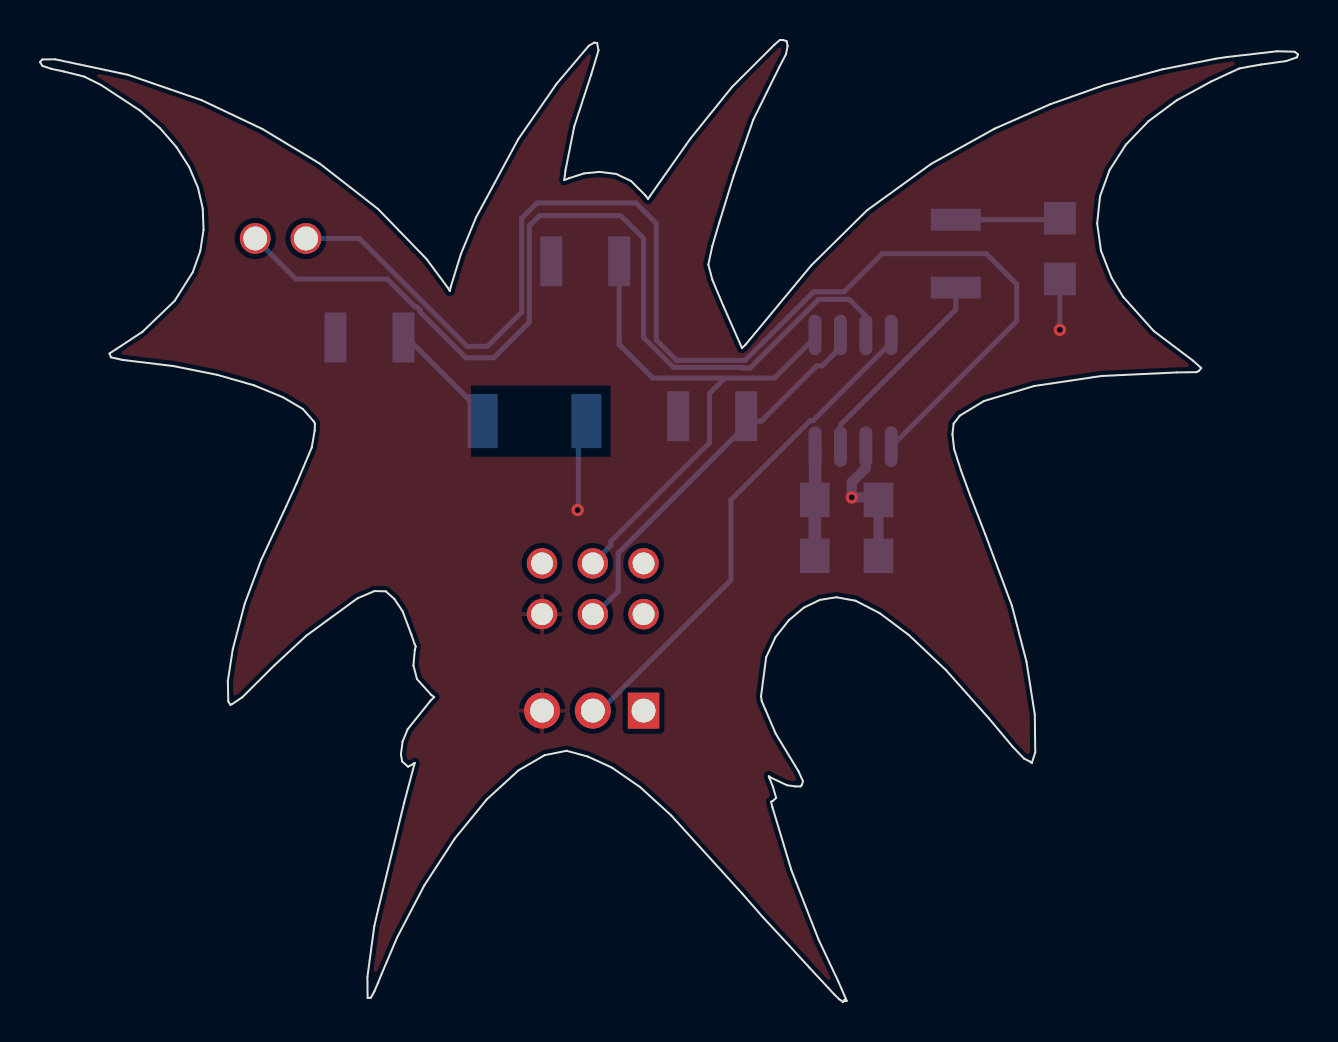
[diagram p7: board, top side]
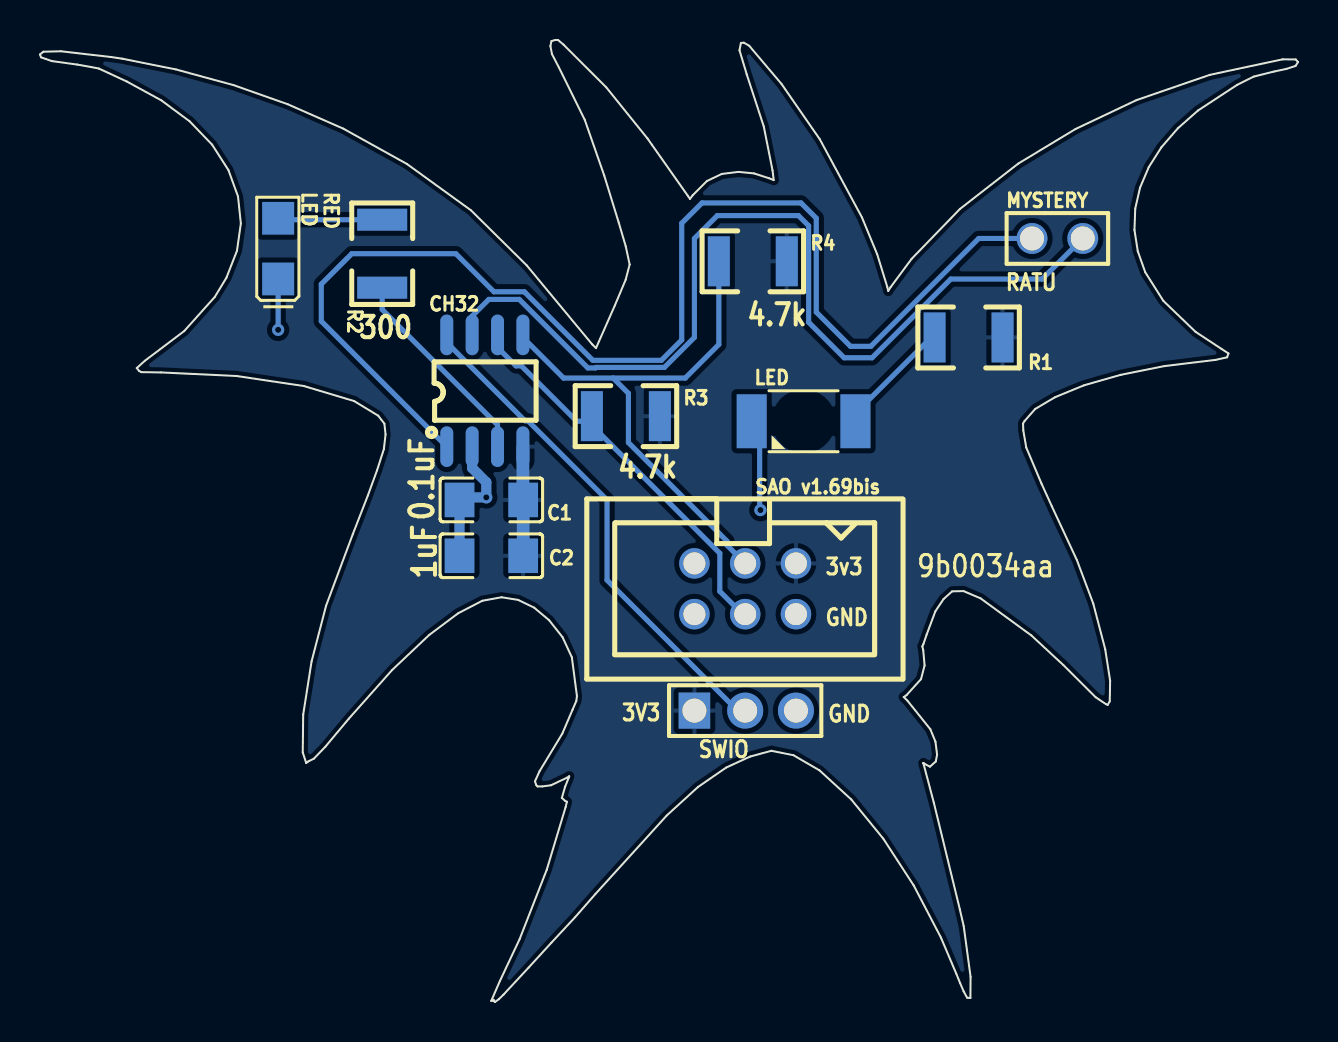
[diagram p8: board, bottom side, seen from below]

Outline 62.95 x 48.13 mm; copper layers: Top Layer, Bottom Layer. Coordinates in mm from the lower left corner of the outline.
Outline path: 0,47.03 0.12,46.83 0.58,46.69 1.19,46.56 2.21,46.3 3.04,45.89 5.01,44.6 6.01,43.71 6.83,42.76 7.47,41.77 7.9,40.74 8.14,39.69 8.18,38.63 8.02,37.57 7.64,36.51 6.74,35.08 5.13,33.53 3.83,32.68 3.48,32.45 3.55,32.26 4.12,32.13 6.69,31.81 8.86,31.38 10.71,30.85 12.16,30.26 13.15,29.67 13.69,29.06 13.76,28.94 13.75,28.6 13.6,27.74 12.83,25.93 12.32,24.8 11.06,22.11 10.25,19.94 9.65,17.64 9.4,16.07 9.42,15.04 9.52,14.87 9.61,14.9 10.12,15.25 11.74,16.86 13.34,18.34 15.88,20.2 16.73,20.56 17.31,20.55 17.74,20.16 18.15,19.54 18.58,18.39 18.74,17.91 18.8,17.79 18.75,17.61 18.68,16.84 18.86,16.15 19.59,15.36 19.73,15.26 19.54,15.08 18.4,13.65 18.14,13.03 18.06,12.38 18.12,12.03 18.41,11.78 18.66,11.9 18.74,11.95 18.75,11.95 18.74,11.94 18.22,9.97 16.92,4.65 16.73,3.8 16.38,1.26 16.39,0.2 16.56,0.22 16.73,0.53 16.91,0.95 17.1,1.42 17.87,3.23 19.23,5.83 20.75,8.18 22.35,10.14 23.94,11.59 25.25,12.35 26.35,12.57 27.41,12.28 28.61,11.73 30.03,10.75 31.59,9.33 35.16,5.4 36.17,4.24 37.35,2.97 38.5,1.72 39.75,0.37 39.99,0.14 40.18,0 40.24,0.06 40.25,0.11 40.28,0.06 40.37,0.06 39.93,1.06 38.95,3.15 37.59,6.61 36.65,9.75 36.58,10.02 36.66,10.06 36.83,10.21 36.67,10.78 36.49,11.21 36.46,11.29 36.58,11.22 37.37,10.85 37.81,10.79 38.05,10.79 38.12,10.86 38.18,11.04 37.95,11.55 36.81,13.43 36.3,14.63 36.11,15.06 36.08,15.31 36.33,17.25 36.8,18.25 37.47,19.1 38.22,19.73 39.02,20.12 39.85,20.25 40.81,20.08 42.02,19.45 43.47,18.36 45.33,16.61 47.49,14.18 48.66,12.77 49.24,12.18 49.52,12.04 49.59,11.99 49.63,11.96 49.8,12.49 49.78,14.38 49.36,17.03 48.63,19.83 47.3,23.4 46.54,25.35 46.08,26.61 45.74,27.66 45.65,28.4 45.71,28.94 46.02,29.34 47.23,30.07 49.75,30.82 53.11,31.32 56.89,31.5 57.87,31.51 57.98,31.57 58.1,31.72 57.69,32.08 55.73,33.57 54.2,35.28 53.62,36.23 53.09,37.59 52.89,38.95 53.04,40.31 53.52,41.62 54.33,42.9 55.46,44.06 56.88,45.12 58.6,46.05 59.52,46.48 60,46.7 60.42,46.78 61.08,46.9 62.36,47.08 62.89,47.26 62.95,47.41 62.78,47.54 61.9,47.57 59.4,47.28 58.83,47.2 56.14,46.66 53.26,45.87 50.56,44.92 47.76,43.69 44.59,41.93 41.38,39.61 38.59,36.85 35.31,32.9 35.12,32.72 34.18,34.85 33.64,36.14 33.44,36.9 33.64,37.81 33.99,38.99 34.71,41.35 35.69,44.14 36.97,46.74 37.33,47.43 37.41,47.83 37.35,48.08 37.16,48.13 37.02,48.13 36.75,47.9 34.61,45.77 32.55,43.2 32.33,42.89 30.53,40.34 30.42,40.18 30.29,40.36 29.57,41.08 28.83,41.43 28,41.53 27.22,41.46 26.47,41.21 26.23,41.12 26.29,41.6 26.73,43.8 27.58,46.41 27.95,47.62 27.87,47.98 27.72,48 27.46,47.84 25.84,45.93 23.93,43.17 21.82,39.26 21.06,37.42 20.55,35.78 20.5,35.58 20.39,35.76 19.34,37.18 16.91,39.68 14,41.94 11.14,43.67 8.08,45.12 4.41,46.39 0.76,47.16 0.12,47.16 0,47.03
Stack: Top Layer 0.035mm / Dielectric1 1.51mm FR4 er 4.5 / Bottom Layer 0.035mm

## Design rules (mm)
template: JLCPCB Capability(Two Layers Board)
spacing copperThickness1oz (default): track to track 0.102, other pairs 0.152 to 0.3
spacing copperThickness2oz: track to track 0.203, other pairs 0.152 to 0.3
track width copperThickness1oz (default): min 0.127, default 0.254, max 2.54
track width copperThickness2oz: min 0.203, default 0.254, max 2.54
differential pair differentialPair (default): width min 0.127, default 0.254, max 2.54; gap min 0.152, default 0.152
via viaSize (default): diameter min 0.5, default 0.61, max 10; hole min 0.3, default 0.305, max 6.3

## Placement (name value [footprint] x y rotation side)
C1  100nF  [C1206]  40.36 25.12 0 bottom
C2  1uF  [C1206]  40.36 22.33 180 bottom
CH32  -  [SOP-8_L4.9-W3.8-P1.27-LS6.0-BL]  40.69 30.58 180 bottom
H1  2.54-1*3  [HDR-TH_3P-P2.54-V-M-1]  27.66 14.58 180 bottom
LED  -  [LED_SMD_PLCC2_SLD]  24.74 29.06 180 bottom
MYSTERY  -  [HDR-TH_2P-P2.54-V-M]  12.04 38.2 180 bottom
R1  10K  [R1206-1]  16.48 33.25 0 bottom
R2  10K  [R1206-1]  45.82 37.44 90 bottom
R3  4.7kΩ  [R1206-1]  33.63 29.31 0 bottom
R4  4.7kΩ  [R1206-1]  27.28 37.06 0 bottom
RED
LED  -  [LED1206-RD]  51.03 37.69 90 bottom
SAO v1.69bis  -  [IDC-TH_6P-P2.54_C11214]  27.66 20.68 0 bottom

## Footprints (pads in the part's own frame, mm; a bottom-side part is the same pattern mirrored in y, then rotated)
C1206
  rect 1.485x1.728 smd: 1(-1.593,0) 2(1.593,0)
HDR-TH_2P-P2.54-V-M
  round 1.542 hole 1.2x1.09: 1(-1.27,0) 2(1.27,0)
HDR-TH_3P-P2.54-V-M-1
  rect 1.575x1.8 hole 1.2: 1(-2.54,0)
  round 1.8 hole 1.2: 2(0,0) 3(2.54,0)
IDC-TH_6P-P2.54_C11214
  round 1.524 hole 1.1: 1(-2.54,-1.27) 2(-2.54,1.27) 3(0,-1.27) 4(0,1.27) 5(2.54,-1.27) 6(2.54,1.27)
LED1206-RD
  rect 1.635x1.6 smd: 1(-1.518,0) 2(1.518,0)
LED_SMD_PLCC2_SLD
  rect 1.5x2.7 smd: 1(-2.597,0) 2(2.597,0)
R1206-1
  rect 1.1x2.5 smd: 1(-1.7,0) 2(1.7,0)
SOP-8_L4.9-W3.8-P1.27-LS6.0-BL
  oval 0.65x2.032 smd: 1(-1.905,-2.796) 2(-0.635,-2.796) 3(0.635,-2.796) 4(1.905,-2.796) 5(1.905,2.796) 6(0.635,2.796) 7(-0.635,2.796) 8(-1.905,2.796)

## Nets
3V3: C1.1 C2.2 CH32.4 H1.1 R1.1 R3.1 R4.1 SAO v1.69bis.1
GND: C1.2 C2.1 CH32.2 H1.3 LED.1 RED
LED.1 SAO v1.69bis.2
PA2: CH32.3 R2.1
PC4: CH32.7 MYSTERY.2
PD6: CH32.1 MYSTERY.1
SCL: CH32.6 R3.2 SAO v1.69bis.4
SDA: CH32.5 R4.2 SAO v1.69bis.3
SWIO: CH32.8 H1.2
$1N236: LED.2 R1.2
$1N1232: R2.2 RED
LED.2

Pads without a net: SAO v1.69bis 5 6

## Via types
v1: diameter 0.61, hole 0.305, Top Layer to Bottom Layer, 3 vias

## Routing (per net, layer and track width the routed paths; a pad name or vN(x,y) marks a point on that pad's centre or on a via; arc(x,y) is an arc through that point)
3V3: length 5.5
  Bottom Layer w0.635: C2.2 C1.1 38.78,25.13 CH32.4
GND: length 14
  Bottom Layer w0.254: 26.94,29.06 26.94,24.65 v1(26.9,24.61) ; RED
LED.1 v1(51.03,33.63)
  Bottom Layer w0.508: C2.1 C1.2 41.83,25.25 v1(40.61,25.25) 40.61,26.01 41.32,26.72 41.32,27.79
PA2: length 10.3
  Bottom Layer w0.254: R2.1 45.82,34.65 40.05,28.88 CH32.3
PC4: length 47.6
  Bottom Layer w0.254: MYSTERY.2 12.8,36.17 17.37,36.17 18.77,34.78 18.85,34.78 19.01,34.61 19.01,34.53 21.31,32.23 22.71,32.23 24.49,34.01 24.49,38.84 24.99,39.34 29.06,39.34 30.2,38.2 30.2,33.25 31.7,31.75 35.13,31.75 35.15,31.72 35.53,31.72 38.96,35.15 40.49,35.15 41.32,34.32 41.32,33.38
PD6: length 63.8
  Bottom Layer w0.254: CH32.1 48.87,34.06 48.87,35.92 47.35,37.44 42.14,37.44 40.23,35.53 38.71,35.53 35.28,32.11 31.85,32.11 30.84,33.12 30.84,38.96 29.82,39.98 24.87,39.98 24.1,39.22 24.1,34.52 22.39,32.8 21.37,32.8 15.98,38.2 MYSTERY.1
SCL: length 20.1
  Bottom Layer w0.254: 40.05,33.38 40.05,32.75 39.13,31.83 38.86,31.83 36.09,29.06 35.58,29.06 R3.2 35.03,29.01 35.03,28.55 28.93,22.45 28.93,20.55 27.79,19.41 SAO v1.69bis.4
SDA: length 27.6
  Bottom Layer w0.254: SAO v1.69bis.3 28.57,22.86 28.57,23.06 33.5,27.99 33.5,30.45 34.26,31.22 ; 38.78,33.38 38.78,33.25 36.75,31.22 34.26,31.22 ; 34.26,31.22 30.66,31.22 28.98,32.9 R4.2
SWIO: length 25.4
  Bottom Layer w0.254: H1.2 28.04,14.58 34.57,21.11 34.57,25.12 38.53,29.08 38.68,29.08 42.47,32.87 42.49,32.87 42.74,33.12 42.74,33.23 42.59,33.38
$1N236: length 6.1
  Bottom Layer w0.254: 22.54,29.06 18.35,33.25 R1.2
$1N1232: length 5.2
  Bottom Layer w0.254: R2.2 50.96,39.14 RED
LED.2

## Copper pours and planes (outline as drawn; the poured copper is in the pictures)
3V3 on Bottom Layer: -1.8,50.01 64.11,50.01 64.11,-1.3 -1.8,-1.3
GND on Top Layer: -0.91,49.5 62.2,49.5 62.2,-2.06 -0.91,-2.06

## Text on the board
Bottom Silkscreen Layer: RATU | GND | 3v3 | SWIO | 3V3 | 9b0034aa | 4.7k | 300 | 1uF | 0.1uF
